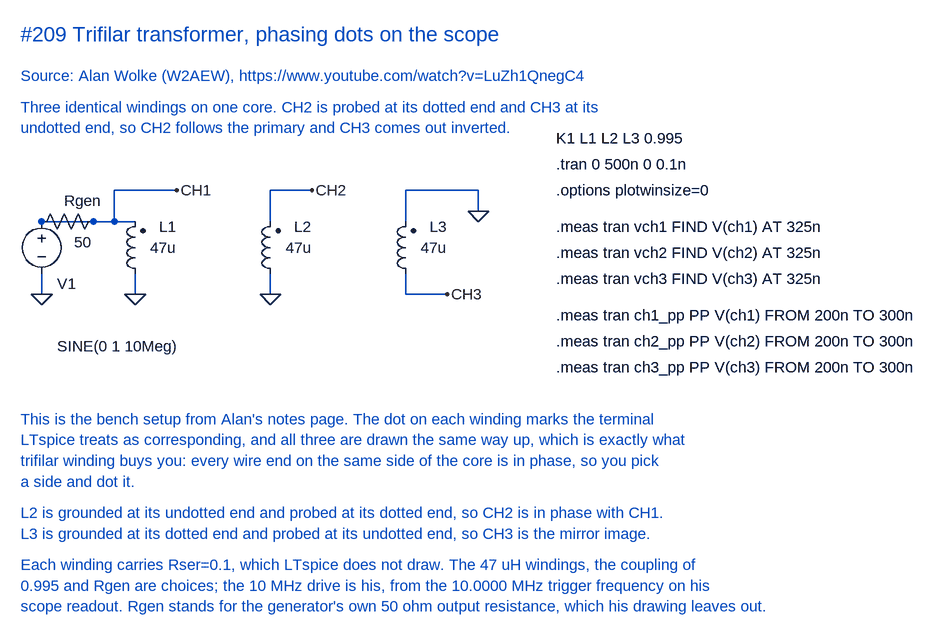
[diagram p0: schematic Trifilar transformer phase dots.asc]
Trifilar transformer phase dots.asc, the LTspice schematic file:
Version 4
SHEET 1 1400 800
WIRE 208 288 288 288
WIRE 288 288 352 288
WIRE 208 368 208 400
WIRE 320 288 320 240
WIRE 320 240 416 240
WIRE 352 368 352 400
WIRE 560 288 560 240
WIRE 560 240 624 240
WIRE 560 368 560 400
WIRE 768 288 768 240
WIRE 768 240 880 240
WIRE 880 240 880 272
WIRE 768 368 768 400
WIRE 768 400 832 400
FLAG 208 400 0
FLAG 352 400 0
FLAG 560 400 0
FLAG 880 272 0
FLAG 416 240 CH1
FLAG 624 240 CH2
FLAG 832 400 CH3
SYMBOL voltage 208 272 R0
WINDOW 0 24 112 Left 2
WINDOW 3 24 208 Left 2
SYMATTR InstName V1
SYMATTR Value SINE(0 1 10Meg)
SYMBOL res 304 272 R90
WINDOW 0 0 32 VBottom 2
WINDOW 3 32 32 VTop 2
SYMATTR InstName Rgen
SYMATTR Value 50
SYMBOL ind2 368 384 R180
WINDOW 0 -48 88 Left 2
WINDOW 3 -48 56 Left 2
SYMATTR InstName L1
SYMATTR Value 47u
SYMATTR SpiceLine Rser=0.1
SYMBOL ind2 576 384 R180
WINDOW 0 -48 88 Left 2
WINDOW 3 -48 56 Left 2
SYMATTR InstName L2
SYMATTR Value 47u
SYMATTR SpiceLine Rser=0.1
SYMBOL ind2 784 384 R180
WINDOW 0 -48 88 Left 2
WINDOW 3 -48 56 Left 2
SYMATTR InstName L3
SYMATTR Value 47u
SYMATTR SpiceLine Rser=0.1
TEXT 176 0 Left 3 ;#209 Trifilar transformer, phasing dots on the scope
TEXT 176 64 Left 2 ;Source: Alan Wolke (W2AEW), https://www.youtube.com/watch?v=LuZh1QnegC4
TEXT 176 112 Left 2 ;Three identical windings on one core. CH2 is probed at its dotted end and CH3 at its
TEXT 176 144 Left 2 ;undotted end, so CH2 follows the primary and CH3 comes out inverted.
TEXT 176 592 Left 2 ;This is the bench setup from Alan's notes page. The dot on each winding marks the terminal
TEXT 176 624 Left 2 ;LTspice treats as corresponding, and all three are drawn the same way up, which is exactly what
TEXT 176 656 Left 2 ;trifilar winding buys you: every wire end on the same side of the core is in phase, so you pick
TEXT 176 688 Left 2 ;a side and dot it.
TEXT 176 736 Left 2 ;L2 is grounded at its undotted end and probed at its dotted end, so CH2 is in phase with CH1.
TEXT 176 768 Left 2 ;L3 is grounded at its dotted end and probed at its undotted end, so CH3 is the mirror image.
TEXT 176 816 Left 2 ;Each winding carries Rser=0.1, which LTspice does not draw. The 47 uH windings, the coupling of
TEXT 176 848 Left 2 ;0.995 and Rgen are choices; the 10 MHz drive is his, from the 10.0000 MHz trigger frequency on his
TEXT 176 880 Left 2 ;scope readout. Rgen stands for the generator's own 50 ohm output resistance, which his drawing leaves out.
TEXT 1000 160 Left 2 !K1 L1 L2 L3 0.995
TEXT 1000 200 Left 2 !.tran 0 500n 0 0.1n
TEXT 1000 240 Left 2 !.options plotwinsize=0
TEXT 1000 296 Left 2 !.meas tran vch1 FIND V(ch1) AT 325n
TEXT 1000 336 Left 2 !.meas tran vch2 FIND V(ch2) AT 325n
TEXT 1000 376 Left 2 !.meas tran vch3 FIND V(ch3) AT 325n
TEXT 1000 432 Left 2 !.meas tran ch1_pp PP V(ch1) FROM 200n TO 300n
TEXT 1000 472 Left 2 !.meas tran ch2_pp PP V(ch2) FROM 200n TO 300n
TEXT 1000 512 Left 2 !.meas tran ch3_pp PP V(ch3) FROM 200n TO 300n

The netlist it stands for:
* Trifilar transformer phase dots.asc
V1 CH1 0 SINE(0 1 10Meg)
Rgen CH1 CH1 50
L1 0 CH1 47u Rser=0.1
L2 0 CH2 47u Rser=0.1
L3 CH3 0 47u Rser=0.1
* #209 Trifilar transformer, phasing dots on the scope
* Source: Alan Wolke (W2AEW), https://www.youtube.com/watch?v=LuZh1QnegC4
* Three identical windings on one core. CH2 is probed at its dotted end and CH3 at its
* undotted end, so CH2 follows the primary and CH3 comes out inverted.
* This is the bench setup from Alan's notes page. The dot on each winding marks the terminal
* LTspice treats as corresponding, and all three are drawn the same way up, which is exactly what
* trifilar winding buys you: every wire end on the same side of the core is in phase, so you pick
* a side and dot it.
* L2 is grounded at its undotted end and probed at its dotted end, so CH2 is in phase with CH1.
* L3 is grounded at its dotted end and probed at its undotted end, so CH3 is the mirror image.
* Each winding carries Rser=0.1, which LTspice does not draw. The 47 uH windings, the coupling of
* 0.995 and Rgen are choices; the 10 MHz drive is his, from the 10.0000 MHz trigger frequency on his
* scope readout. Rgen stands for the generator's own 50 ohm output resistance, which his drawing leaves out.
K1 L1 L2 L3 0.995
.tran 0 500n 0 0.1n
.options plotwinsize=0
.meas tran vch1 FIND V(ch1) AT 325n
.meas tran vch2 FIND V(ch2) AT 325n
.meas tran vch3 FIND V(ch3) AT 325n
.meas tran ch1_pp PP V(ch1) FROM 200n TO 300n
.meas tran ch2_pp PP V(ch2) FROM 200n TO 300n
.meas tran ch3_pp PP V(ch3) FROM 200n TO 300n
.backanno
.end